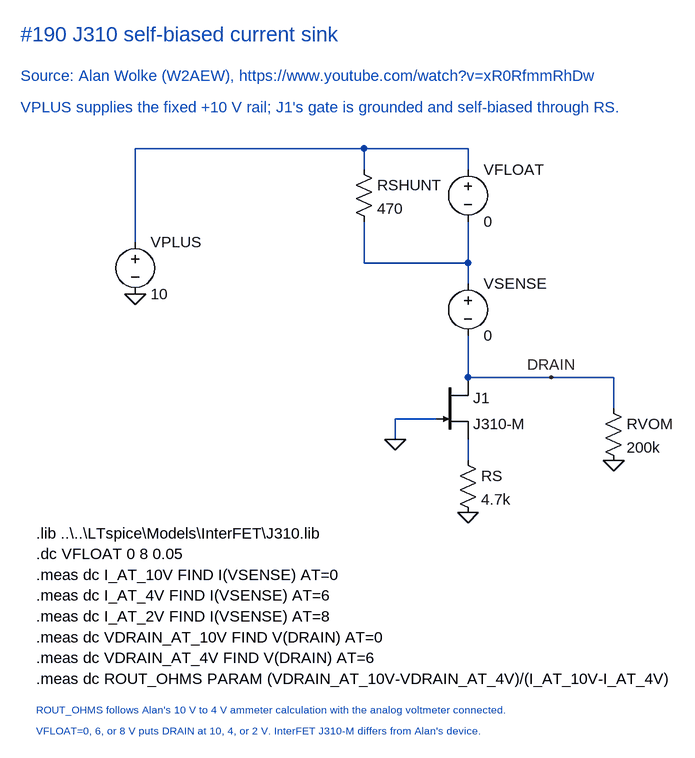
[diagram p0: schematic J310 self-biased current sink.asc]
J310 self-biased current sink.asc, the LTspice schematic file:
Version 4.1
SHEET 1 1440 950
WIRE 736 -96 576 -96
WIRE 576 -96 224 -96
WIRE 224 0 224 -96
WIRE 576 -64 576 -96
WIRE 736 -64 736 -96
WIRE 224 48 224 0
WIRE 576 80 576 16
WIRE 736 80 736 16
WIRE 736 80 576 80
WIRE 736 112 736 80
WIRE 736 256 736 192
WIRE 864 256 736 256
WIRE 960 256 864 256
WIRE 960 304 960 256
WIRE 688 320 624 320
WIRE 624 352 624 320
WIRE 736 384 736 352
FLAG 224 128 0
FLAG 864 256 DRAIN
FLAG 624 352 0
FLAG 736 464 0
FLAG 960 384 0
SYMBOL voltage 224 32 R0
SYMATTR InstName VPLUS
SYMATTR Value 10
SYMBOL voltage 736 -80 R0
SYMATTR InstName VFLOAT
SYMATTR Value 0
SYMBOL res 560 -80 R0
SYMATTR InstName RSHUNT
SYMATTR Value 470
SYMBOL voltage 736 96 R0
SYMATTR InstName VSENSE
SYMATTR Value 0
SYMBOL njf 688 256 R0
SYMATTR InstName J1
SYMATTR Value J310-M
SYMBOL res 720 368 R0
SYMATTR InstName RS
SYMATTR Value 4.7k
SYMBOL res 944 288 R0
SYMATTR InstName RVOM
SYMATTR Value 200k
TEXT 48 -272 Left 3 ;#190 J310 self-biased current sink
TEXT 48 -208 Left 2 ;Source: Alan Wolke (W2AEW), https://www.youtube.com/watch?v=xR0RfmmRhDw
TEXT 48 -160 Left 2 ;VPLUS supplies the fixed +10 V rail; J1's gate is grounded and self-biased through RS.
TEXT 72 496 Left 2 !.lib ..\\..\\LTspice\\Models\\InterFET\\J310.lib
TEXT 72 528 Left 2 !.dc VFLOAT 0 8 0.05
TEXT 72 560 Left 2 !.meas dc I_AT_10V FIND I(VSENSE) AT=0
TEXT 72 592 Left 2 !.meas dc I_AT_4V FIND I(VSENSE) AT=6
TEXT 72 624 Left 2 !.meas dc I_AT_2V FIND I(VSENSE) AT=8
TEXT 72 656 Left 2 !.meas dc VDRAIN_AT_10V FIND V(DRAIN) AT=0
TEXT 72 688 Left 2 !.meas dc VDRAIN_AT_4V FIND V(DRAIN) AT=6
TEXT 72 720 Left 2 !.meas dc ROUT_OHMS PARAM (VDRAIN_AT_10V-VDRAIN_AT_4V)/(I_AT_10V-I_AT_4V)
TEXT 72 768 Left 1 ;ROUT_OHMS follows Alan's 10 V to 4 V ammeter calculation with the analog voltmeter connected.
TEXT 72 800 Left 1 ;VFLOAT=0, 6, or 8 V puts DRAIN at 10, 4, or 2 V. InterFET J310-M differs from Alan's device.

The netlist it stands for:
* J310 self-biased current sink.asc
VPLUS N001 0 10
VFLOAT N001 N002 0
RSHUNT N001 N002 470
VSENSE N002 DRAIN 0
J1 DRAIN 0 N003 J310-M
RS N003 0 4.7k
RVOM DRAIN 0 200k
.model NJF NJF
.model PJF PJF
.lib standard.jft
* #190 J310 self-biased current sink
* Source: Alan Wolke (W2AEW), https://www.youtube.com/watch?v=xR0RfmmRhDw
* VPLUS supplies the fixed +10 V rail; J1's gate is grounded and self-biased through RS.
.lib ..\..\LTspice\Models\InterFET\J310.lib
.dc VFLOAT 0 8 0.05
.meas dc I_AT_10V FIND I(VSENSE) AT=0
.meas dc I_AT_4V FIND I(VSENSE) AT=6
.meas dc I_AT_2V FIND I(VSENSE) AT=8
.meas dc VDRAIN_AT_10V FIND V(DRAIN) AT=0
.meas dc VDRAIN_AT_4V FIND V(DRAIN) AT=6
.meas dc ROUT_OHMS PARAM (VDRAIN_AT_10V-VDRAIN_AT_4V)/(I_AT_10V-I_AT_4V)
* ROUT_OHMS follows Alan's 10 V to 4 V ammeter calculation with the analog voltmeter connected.
* VFLOAT=0, 6, or 8 V puts DRAIN at 10, 4, or 2 V. InterFET J310-M differs from Alan's device.
.backanno
.end